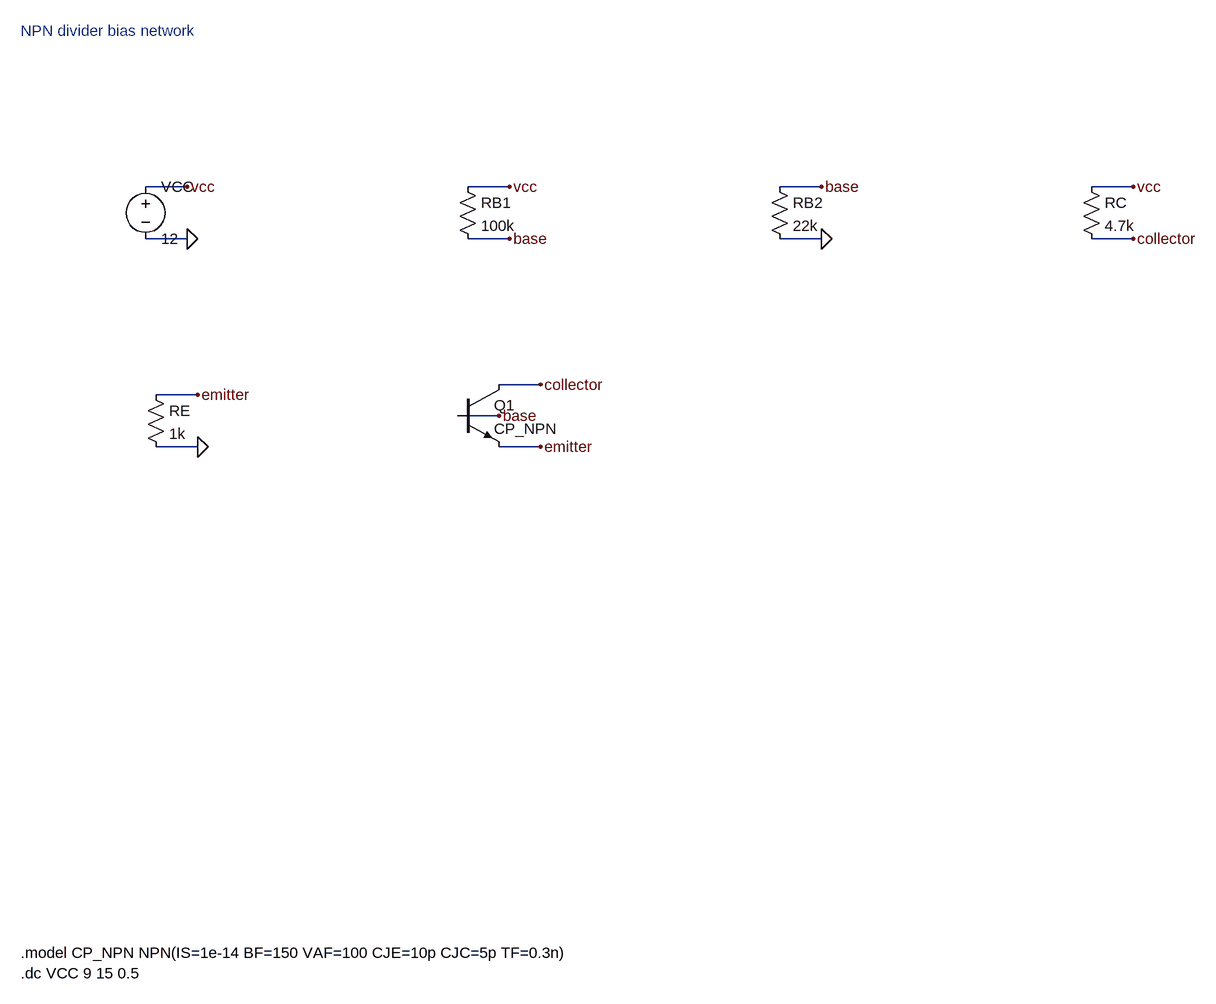
[diagram p0: schematic bjt-bias-network.asc]
bjt-bias-network.asc, the LTspice schematic file:
Version 4
SHEET 1 2400 2000
TEXT 64 32 Left 2 ;NPN divider bias network
SYMBOL voltage 256 256 R0
SYMATTR InstName VCC
SYMATTR Value 12
WIRE 320 272 256 272
FLAG 320 272 vcc
WIRE 320 352 256 352
FLAG 320 352 0
SYMBOL res 736 256 R0
SYMATTR InstName RB1
SYMATTR Value 100k
WIRE 816 272 752 272
FLAG 816 272 vcc
WIRE 816 352 752 352
FLAG 816 352 base
SYMBOL res 1216 256 R0
SYMATTR InstName RB2
SYMATTR Value 22k
WIRE 1296 272 1232 272
FLAG 1296 272 base
WIRE 1296 352 1232 352
FLAG 1296 352 0
SYMBOL res 1696 256 R0
SYMATTR InstName RC
SYMATTR Value 4.7k
WIRE 1776 272 1712 272
FLAG 1776 272 vcc
WIRE 1776 352 1712 352
FLAG 1776 352 collector
SYMBOL res 256 576 R0
SYMATTR InstName RE
SYMATTR Value 1k
WIRE 336 592 272 592
FLAG 336 592 emitter
WIRE 336 672 272 672
FLAG 336 672 0
SYMBOL npn 736 576 R0
SYMATTR InstName Q1
SYMATTR Value CP_NPN
WIRE 864 576 800 576
FLAG 864 576 collector
WIRE 800 624 736 624
FLAG 800 624 base
WIRE 864 672 800 672
FLAG 864 672 emitter
TEXT 64 1450 Left 2 !.model CP_NPN NPN(IS=1e-14 BF=150 VAF=100 CJE=10p CJC=5p TF=0.3n)
TEXT 64 1482 Left 2 !.dc VCC 9 15 0.5

The netlist it stands for:
* bjt-bias-network.asc
VCC vcc 0 12
RB1 vcc base 100k
RB2 base 0 22k
RC vcc collector 4.7k
RE emitter 0 1k
Q1 collector base emitter 0 CP_NPN
.model NPN NPN
.model PNP PNP
.lib standard.bjt
* NPN divider bias network
.model CP_NPN NPN(IS=1e-14 BF=150 VAF=100 CJE=10p CJC=5p TF=0.3n)
.dc VCC 9 15 0.5
.backanno
.end